# Altium schematic sheet Top-Sheet.SchDoc
size 420 x 297 mm; SheetNumber: 1; SheetTotal: 5
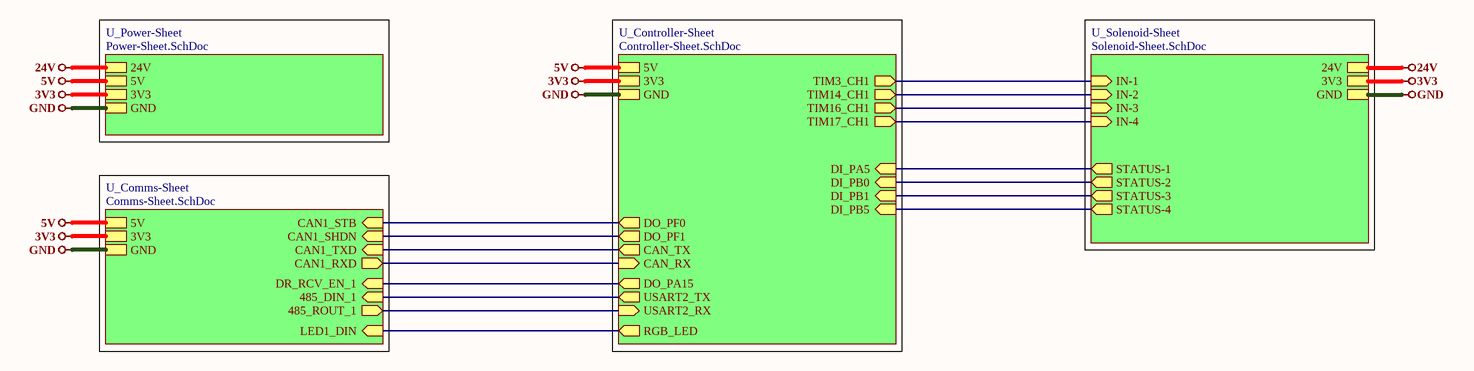
[diagram p0: Top-Sheet.SchDoc]

## Sub-sheets
U_Comms-Sheet = Comms-Sheet.SchDoc: CAN1_STB (in), CAN1_TXD (in), CAN1_RXD (out), CAN1_SHDN (in), LED1_DIN (in), DR_RCV_EN_1 (in), 485_ROUT_1 (out), 485_DIN_1 (in), GND, 3V3, 5V
U_Controller-Sheet = Controller-Sheet.SchDoc: GND, 3V3, 5V, CAN_RX (in), CAN_TX (out), USART2_RX (in), USART2_TX (out), TIM14_CH1 (out), TIM16_CH1 (out), TIM17_CH1 (out), TIM3_CH1 (out), RGB_LED (out), DI_PA5 (in), DI_PB0 (in), DI_PB1 (in), DI_PB5 (in), DO_PA15 (out), DO_PF0 (out), DO_PF1 (out)
U_Power-Sheet = Power-Sheet.SchDoc: GND, 3V3, 5V, 24V
U_Solenoid-Sheet = Solenoid-Sheet.SchDoc: GND, 3V3, STATUS-1 (out), STATUS-2 (out), STATUS-3 (out), STATUS-4 (out), IN-1 (in), IN-2 (in), IN-3 (in), IN-4 (in), 24V

## Nets
3V3: sheet U_Power-Sheet/3V3, sheet U_Comms-Sheet/3V3, sheet U_Controller-Sheet/3V3, sheet U_Solenoid-Sheet/3V3
5V: sheet U_Power-Sheet/5V, sheet U_Comms-Sheet/5V, sheet U_Controller-Sheet/5V
24V: sheet U_Power-Sheet/24V, sheet U_Solenoid-Sheet/24V
GND: sheet U_Power-Sheet/GND, sheet U_Comms-Sheet/GND, sheet U_Controller-Sheet/GND, sheet U_Solenoid-Sheet/GND
(unnamed): sheet U_Comms-Sheet/CAN1_STB, sheet U_Controller-Sheet/DO_PF0
(unnamed): sheet U_Comms-Sheet/CAN1_TXD, sheet U_Controller-Sheet/CAN_TX
(unnamed): sheet U_Comms-Sheet/CAN1_RXD, sheet U_Controller-Sheet/CAN_RX
(unnamed): sheet U_Comms-Sheet/CAN1_SHDN, sheet U_Controller-Sheet/DO_PF1
(unnamed): sheet U_Comms-Sheet/LED1_DIN, sheet U_Controller-Sheet/RGB_LED
(unnamed): sheet U_Comms-Sheet/DR_RCV_EN_1, sheet U_Controller-Sheet/DO_PA15
(unnamed): sheet U_Comms-Sheet/485_ROUT_1, sheet U_Controller-Sheet/USART2_RX
(unnamed): sheet U_Comms-Sheet/485_DIN_1, sheet U_Controller-Sheet/USART2_TX
(unnamed): sheet U_Controller-Sheet/TIM14_CH1, sheet U_Solenoid-Sheet/IN-2
(unnamed): sheet U_Controller-Sheet/TIM16_CH1, sheet U_Solenoid-Sheet/IN-3
(unnamed): sheet U_Controller-Sheet/TIM17_CH1, sheet U_Solenoid-Sheet/IN-4
(unnamed): sheet U_Controller-Sheet/TIM3_CH1, sheet U_Solenoid-Sheet/IN-1
(unnamed): sheet U_Controller-Sheet/DI_PA5, sheet U_Solenoid-Sheet/STATUS-1
(unnamed): sheet U_Controller-Sheet/DI_PB0, sheet U_Solenoid-Sheet/STATUS-2
(unnamed): sheet U_Controller-Sheet/DI_PB1, sheet U_Solenoid-Sheet/STATUS-3
(unnamed): sheet U_Controller-Sheet/DI_PB5, sheet U_Solenoid-Sheet/STATUS-4

## Notes on the sheet
- File:
- Title:
- Date:
- Page
- Num:
- Total:
- Drawn By: Huzaifa Ali